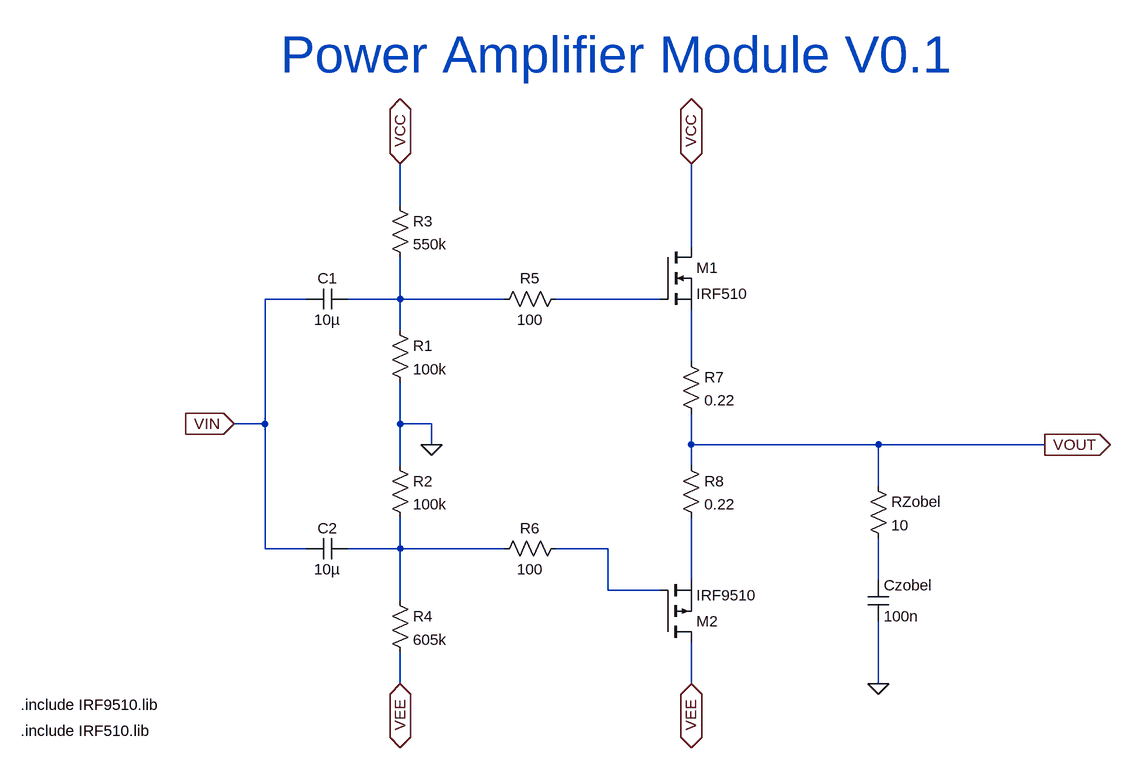
[diagram p0: schematic ZPowerAmpModule_LTspice.asc]
ZPowerAmpModule_LTspice.asc, the LTspice schematic file:
Version 4.1
SHEET 1 1292 680
WIRE 176 -160 176 -224
WIRE 624 -96 624 -224
WIRE 32 -16 -32 -16
WIRE 176 -16 176 -80
WIRE 176 -16 96 -16
WIRE 336 -16 176 -16
WIRE 576 -16 416 -16
WIRE 176 32 176 -16
WIRE 624 80 624 0
WIRE -32 176 -32 -16
WIRE -32 176 -80 176
WIRE 176 176 176 112
WIRE 224 176 176 176
WIRE 224 208 224 176
WIRE 624 208 624 160
WIRE 912 208 624 208
WIRE 1168 208 912 208
WIRE 176 240 176 176
WIRE 624 240 624 208
WIRE 912 272 912 208
WIRE -32 368 -32 176
WIRE 32 368 -32 368
WIRE 176 368 176 320
WIRE 176 368 96 368
WIRE 336 368 176 368
WIRE 496 368 416 368
WIRE 624 416 624 320
WIRE 912 416 912 352
WIRE 496 432 496 368
WIRE 576 432 496 432
WIRE 176 448 176 368
WIRE 176 576 176 528
WIRE 624 576 624 512
WIRE 912 576 912 480
FLAG -80 176 VIN
IOPIN -80 176 In
FLAG 224 208 0
FLAG 176 -224 VCC
IOPIN 176 -224 BiDir
FLAG 176 576 VEE
IOPIN 176 576 BiDir
FLAG 624 -224 VCC
IOPIN 624 -224 BiDir
FLAG 624 576 VEE
IOPIN 624 576 BiDir
FLAG 912 576 0
FLAG 1168 208 VOUT
IOPIN 1168 208 Out
SYMBOL res 160 16 R0
SYMATTR InstName R1
SYMATTR Value 100k
SYMBOL res 160 224 R0
SYMATTR InstName R2
SYMATTR Value 100k
SYMBOL res 160 -176 R0
SYMATTR InstName R3
SYMATTR Value 550k
SYMBOL res 160 432 R0
SYMATTR InstName R4
SYMATTR Value 605k
SYMBOL res 432 -32 R90
WINDOW 0 0 56 VBottom 2
WINDOW 3 32 56 VTop 2
SYMATTR InstName R5
SYMATTR Value 100
SYMBOL res 432 352 R90
WINDOW 0 0 56 VBottom 2
WINDOW 3 32 56 VTop 2
SYMATTR InstName R6
SYMATTR Value 100
SYMBOL pmos 576 512 M180
SYMATTR InstName M2
SYMATTR Value IRF9510
SYMATTR Prefix X
SYMBOL res 608 64 R0
SYMATTR InstName R7
SYMATTR Value 0.22
SYMATTR SpiceLine pwr=5
SYMBOL res 608 224 R0
SYMATTR InstName R8
SYMATTR Value 0.22
SYMATTR SpiceLine pwr=5
SYMBOL res 896 256 R0
SYMATTR InstName RZobel
SYMATTR Value 10
SYMBOL cap 896 416 R0
SYMATTR InstName Czobel
SYMATTR Value 100n
SYMBOL nmos 576 -96 R0
SYMATTR InstName M1
SYMATTR Value IRF510
SYMATTR Prefix X
SYMBOL cap 96 -32 R90
WINDOW 0 0 32 VBottom 2
WINDOW 3 32 32 VTop 2
SYMATTR InstName C1
SYMATTR Value 10µ
SYMBOL cap 96 352 R90
WINDOW 0 0 32 VBottom 2
WINDOW 3 32 32 VTop 2
SYMATTR InstName C2
SYMATTR Value 10µ
TEXT -8 -392 Left 6 ;Power Amplifier Module V0.1
TEXT -408 608 Left 2 !.include IRF9510.lib
TEXT -408 648 Left 2 !.include IRF510.lib

The netlist it stands for:
* ZPowerAmpModule_LTspice.asc
R1 N001 0 100k
R2 0 N004 100k
R3 VCC N001 550k
R4 N004 VEE 605k
R5 N002 N001 100
R6 N005 N004 100
X§M2 VEE N005 N006 IRF9510  ; pins D G S
R7 N003 VOUT 0.22 pwr=5
R8 VOUT N006 0.22 pwr=5
RZobel VOUT N007 10
Czobel N007 0 100n
X§M1 VCC N002 N003 IRF510  ; pins D G S
C1 N001 VIN 10µ
C2 N004 VIN 10µ
* Power Amplifier Module V0.1
.include IRF9510.lib
.include IRF510.lib
.backanno
.end